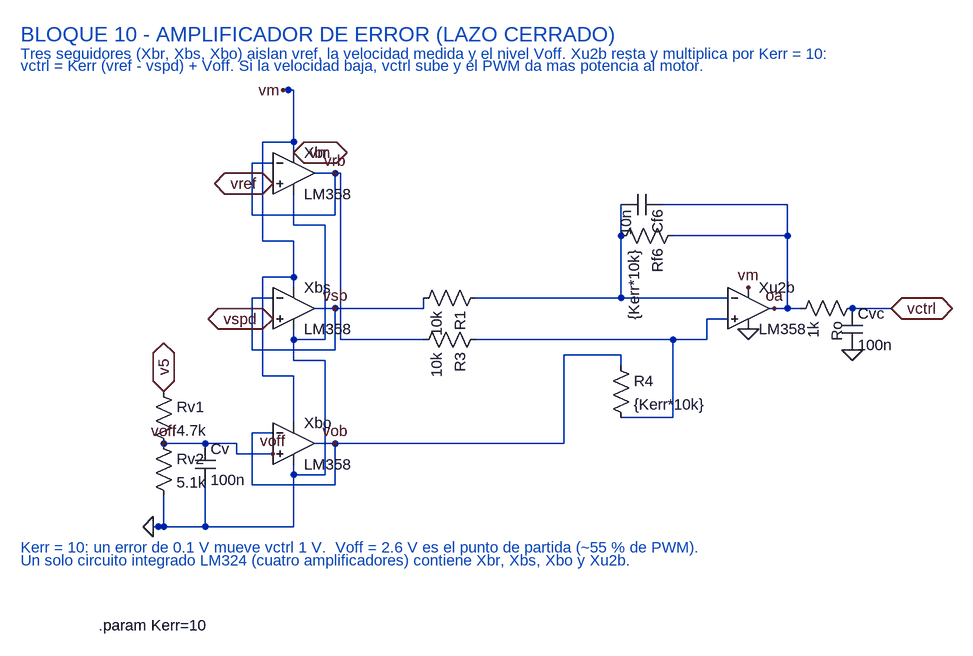
[diagram p0: schematic BLOQUE_ERROR_AMP.asc]
BLOQUE_ERROR_AMP.asc, the LTspice schematic file:
Version 4
SHEET 1 1500 900
WIRE 232 64 264 64
WIRE 264 64 264 128
WIRE 264 128 136 128
WIRE 136 128 136 48
WIRE 136 48 168 48
WIRE 232 272 264 272
WIRE 264 272 264 336
WIRE 264 336 136 336
WIRE 136 336 136 256
WIRE 136 256 168 256
WIRE 232 480 264 480
WIRE 264 480 264 544
WIRE 264 544 136 544
WIRE 136 544 136 464
WIRE 136 464 168 464
WIRE 0 480 64 480
WIRE 64 480 112 480
WIRE 112 480 112 496
WIRE 112 496 168 496
WIRE 480 256 704 256
WIRE 704 256 868 256
WIRE 480 320 704 320
WIRE 704 320 784 320
WIRE 784 320 836 320
WIRE 836 320 836 288
WIRE 836 288 868 288
WIRE 704 440 784 440
WIRE 784 440 784 320
WIRE 704 256 704 160
WIRE 784 160 960 160
WIRE 704 160 704 112
WIRE 768 112 960 112
WIRE 960 112 960 160
WIRE 960 160 960 272
WIRE 932 272 960 272
WIRE 960 272 980 272
WIRE 1060 272 1120 272
WIRE 704 360 704 344
WIRE 704 344 616 344
WIRE 616 344 616 480
WIRE 616 480 264 480
WIRE 400 320 272 320
WIRE 272 320 272 64
WIRE 272 64 264 64
WIRE 400 256 400 272
WIRE 400 272 264 272
WIRE 184 -64 200 -64
WIRE 184 -64 192 -64
WIRE 200 32 200 -64
WIRE 200 240 200 168
WIRE 200 168 152 168
WIRE 152 168 152 16
WIRE 152 16 200 16
WIRE 200 448 200 376
WIRE 200 376 152 376
WIRE 152 376 152 224
WIRE 152 224 200 224
WIRE -16 608 200 608
WIRE -16 608 -8 608
WIRE 0 560 0 608
WIRE 64 544 64 608
WIRE 200 512 200 608
WIRE 200 304 200 352
WIRE 200 352 248 352
WIRE 248 352 248 528
WIRE 248 528 200 528
WIRE 200 96 200 144
WIRE 200 144 248 144
WIRE 248 144 248 320
WIRE 248 320 200 320
FLAG 168 80 vref
FLAG 200 32 vm
FLAG 264 64 vrb
FLAG 168 288 vspd
FLAG 264 272 vsb
FLAG 168 496 voff
FLAG 264 480 vob
FLAG 0 400 v5
FLAG 0 480 voff
FLAG 900 240 vm
FLAG 900 304 0
FLAG 940 272 oa
FLAG 1060 336 0
FLAG 1120 272 vctrl
FLAG 184 -64 vm
FLAG -16 608 0
IOPIN 168 80 BiDir
IOPIN 200 32 BiDir
IOPIN 168 288 BiDir
IOPIN 0 400 BiDir
IOPIN 1120 272 BiDir
SYMBOL OpAmps\opamp2 200 0 R0
SYMATTR InstName Xbr
SYMATTR Value LM358
SYMBOL OpAmps\opamp2 200 208 R0
SYMATTR InstName Xbs
SYMATTR Value LM358
SYMBOL OpAmps\opamp2 200 416 R0
SYMATTR InstName Xbo
SYMATTR Value LM358
SYMBOL res -16 384 R0
SYMATTR InstName Rv1
SYMATTR Value 4.7k
SYMBOL res -16 464 R0
SYMATTR InstName Rv2
SYMATTR Value 5.1k
SYMBOL cap 48 480 R0
SYMATTR InstName Cv
SYMATTR Value 100n
SYMBOL res 496 240 R90
SYMATTR InstName R1
SYMATTR Value 10k
SYMBOL res 496 304 R90
SYMATTR InstName R3
SYMATTR Value 10k
SYMBOL res 688 344 R0
SYMATTR InstName R4
SYMATTR Value {Kerr*10k}
SYMBOL res 800 144 R90
SYMATTR InstName Rf6
SYMATTR Value {Kerr*10k}
SYMBOL cap 768 96 R90
SYMATTR InstName Cf6
SYMATTR Value 10n
SYMBOL OpAmps\opamp2 900 208 R0
SYMATTR InstName Xu2b
SYMATTR Value LM358
SYMBOL res 1076 256 R90
SYMATTR InstName Ro
SYMATTR Value 1k
SYMBOL cap 1044 272 R0
SYMATTR InstName Cvc
SYMATTR Value 100n
TEXT -220 -150 Left 3 ;BLOQUE 10 - AMPLIFICADOR DE ERROR (LAZO CERRADO)
TEXT -220 -120 Left 2 ;Tres seguidores (Xbr, Xbs, Xbo) aislan vref, la velocidad medida y el nivel Voff. Xu2b resta y multiplica por Kerr = 10:
TEXT -220 -102 Left 2 ;vctrl = Kerr (vref - vspd) + Voff. Si la velocidad baja, vctrl sube y el PWM da mas potencia al motor.
TEXT -220 640 Left 2 ;Kerr = 10: un error de 0.1 V mueve vctrl 1 V.  Voff = 2.6 V es el punto de partida (~55 % de PWM).
TEXT -220 660 Left 2 ;Un solo circuito integrado LM324 (cuatro amplificadores) contiene Xbr, Xbs, Xbo y Xu2b.
TEXT -100 760 Left 2 !.param Kerr=10

The netlist it stands for:
* BLOQUE_ERROR_AMP.asc
XXbr vref vrb vm 0 vrb LM358  ; pins In+ In- V+ V- OUT
XXbs vspd vsb vm 0 vsb LM358  ; pins In+ In- V+ V- OUT
XXbo voff vob vm 0 vob LM358  ; pins In+ In- V+ V- OUT
Rv1 v5 voff 4.7k
Rv2 voff 0 5.1k
Cv voff 0 100n
R1 N001 vsb 10k
R3 N002 vrb 10k
R4 vob N002 {Kerr*10k}
Rf6 oa N001 {Kerr*10k}
Cf6 oa N001 10n
XXu2b N002 N001 vm 0 oa LM358  ; pins In+ In- V+ V- OUT
Ro vctrl oa 1k
Cvc vctrl 0 100n
* BLOQUE 10 - AMPLIFICADOR DE ERROR (LAZO CERRADO)
* Tres seguidores (Xbr, Xbs, Xbo) aislan vref, la velocidad medida y el nivel Voff. Xu2b resta y multiplica por Kerr = 10:
* vctrl = Kerr (vref - vspd) + Voff. Si la velocidad baja, vctrl sube y el PWM da mas potencia al motor.
* Kerr = 10: un error de 0.1 V mueve vctrl 1 V.  Voff = 2.6 V es el punto de partida (~55 % de PWM).
* Un solo circuito integrado LM324 (cuatro amplificadores) contiene Xbr, Xbs, Xbo y Xu2b.
.param Kerr=10
.backanno
.end